# Altium schematic sheet Sheet1.SchDoc
size A4; SheetNumber: 1; SheetTotal: 1
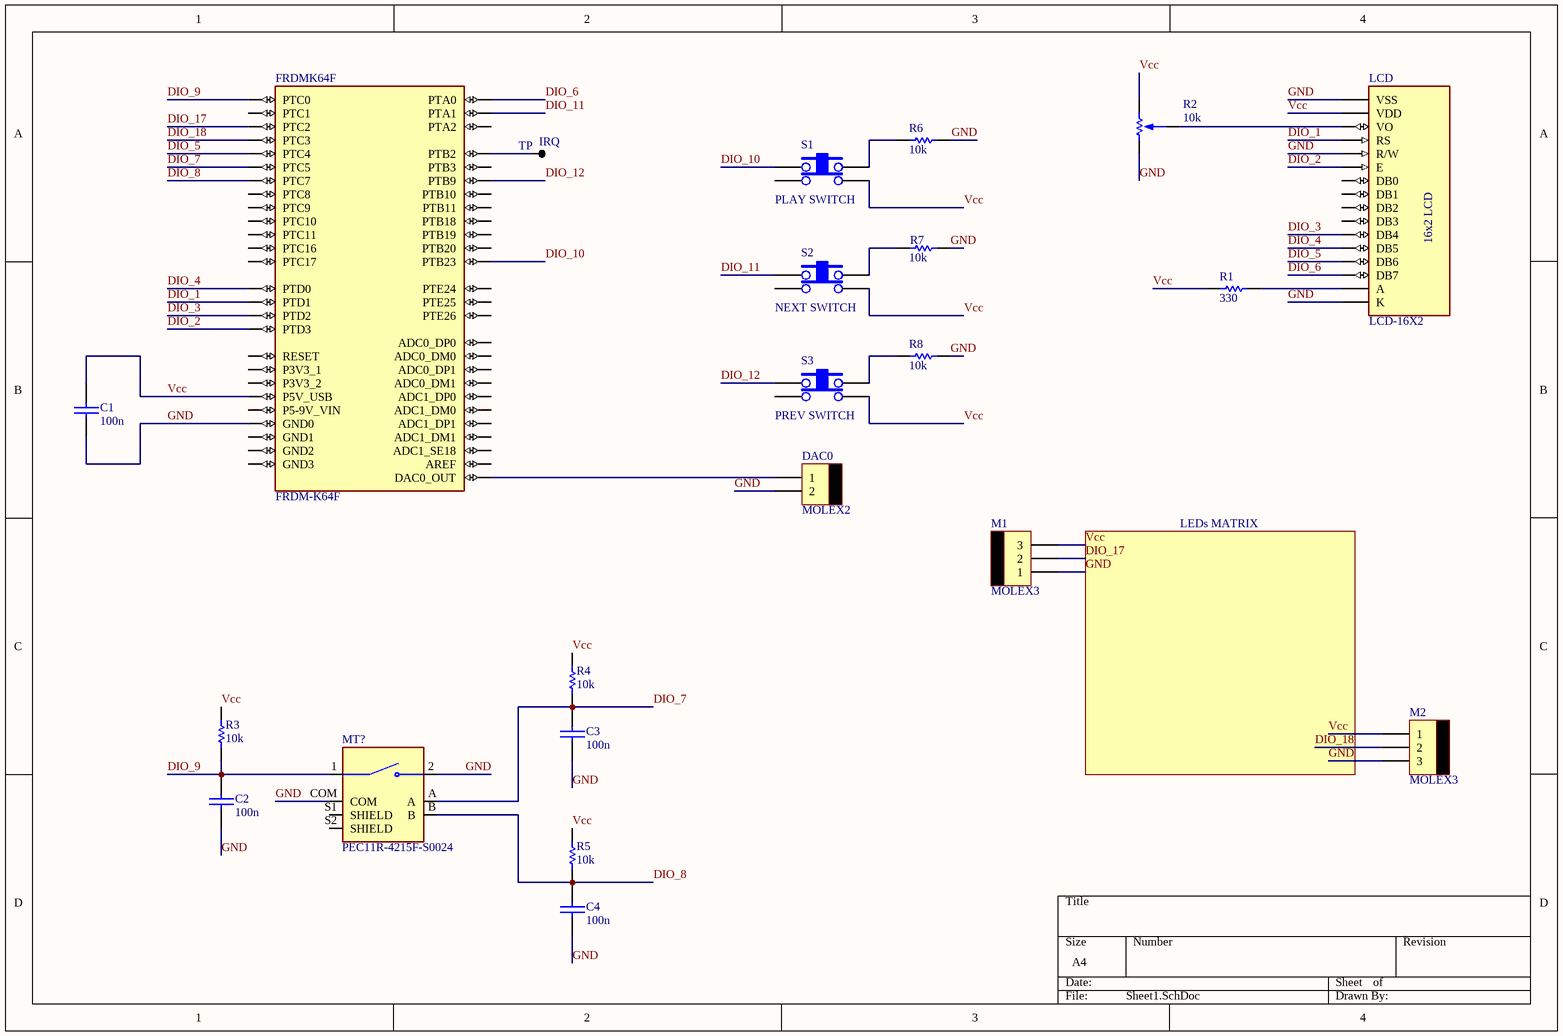
[diagram p0: Sheet1.SchDoc]

## Parts
C1  100n  [0805]
C2  100n  [0805]
C3  100n  [0805]
C4  100n  [0805]
DAC0  MOLEX2  [MOLEX2]
FRDMK64F  FRDM-K64F  [FRDM-K64F]
IRQ  TP  [TPTH]
LCD  LCD-16X2  [MODULE_LCD-16X2]
M1  MOLEX3  [MOLEX3]
M2  MOLEX3  [MOLEX3]
MT?  PEC11R-4215F-S0024  [XDCR_PEC11R-4215F-S0024]
R1  330  [0805]
R2  10k  [PRESET V]
R3  10k  [0805]
R4  10k  [0805]
R5  10k  [0805]
R6  10k  [0805]
R7  10k  [0805]
R8  10k  [0805]
S1  PLAY SWITCH  [TACTSWITCH]
S2  NEXT SWITCH  [TACTSWITCH]
S3  PREV SWITCH  [TACTSWITCH]

## Nets
DIO_1: FRDMK64F.J2-12(PTD1) LCD.4(RS)
DIO_2: FRDMK64F.J2-10(PTD3) LCD.6(E)
DIO_3: FRDMK64F.J2-8(PTD2) LCD.11(DB4)
DIO_4: FRDMK64F.J2-6(PTD0) LCD.12(DB5)
DIO_5: FRDMK64F.J2-4(PTC4) LCD.13(DB6)
DIO_6: FRDMK64F.J2-2(PTA0) LCD.14(DB7)
DIO_7: C3.1 FRDMK64F.J1-15(PTC5) MT?.A R4.1
DIO_8: C4.1 FRDMK64F.J1-13(PTC7) MT?.B R5.1
DIO_9: C2.1 FRDMK64F.J1-11(PTC0) MT?.1 R3.1
DIO_10: FRDMK64F.J1-10(PTB23) S1.1
DIO_11: FRDMK64F.J1-8(PTA1) S2.1
DIO_12: FRDMK64F.J1-6(PTB9) S3.1
DIO_17: FRDMK64F.J1-14(PTC2) M1.2
DIO_18: FRDMK64F.J1-16(PTC3) M2.2
GND: C1.2 C2.2 C3.2 C4.2 DAC0.2 FRDMK64F.J2-3(GND0) LCD.1(VSS) LCD.5(R/W) LCD.16(K) M1.1 M2.3 MT?.2 MT?.COM R2.3 R6.1 R7.1 R8.1
Vcc: C1.1 FRDMK64F.J3-10(P5V_USB) LCD.2(VDD) M1.3 M2.1 R1.1 R2.1 R3.2 R4.2 R5.2 S1.4 S2.4 S3.4
NetDAC0_1: DAC0.1 FRDMK64F.J4-11(DAC0_OUT)
NetFRDMK64F_J4-2: FRDMK64F.J4-2(PTB2) IRQ.1
NetLCD_3: LCD.3(VO) R2.2
NetLCD_15: LCD.15(A) R1.2
NetR6_2: R6.2 S1.3
NetR7_2: R7.2 S2.3
NetR8_2: R8.2 S3.3

Not connected (* = marked no-connect by the designer): FRDMK64F J1-1(PTB18) J1-2(PTC16) J1-3(PTB19) J1-4(PTC17) J1-5(PTC1) J1-7(PTC8) J1-9(PTC9) J1-12(PTA2) J2-1(PTE26) J2-5(ADC0_DP0) J2-7(ADC0_DM0) J2-11(ADC1_DP0) J2-13(ADC1_DM0) J2-14(GND1) J2-16(AREF) J2-17(ADC1_SE18) J2-18(PTE25) J2-20(PTE24) J3-4(P3V3_1) J3-6(RESET) J3-8(P3V3_2) J3-12(GND2) J3-14(GND3) J3-16(P5-9V_VIN) J4-1(ADC0_DP1) J4-3(ADC0_DM1) J4-4(PTB3) J4-5(ADC1_DP1) J4-6(PTB10) J4-7(ADC1_DM1) J4-8(PTB11) J4-9(PTB20) J4-10(PTC11) J4-12(PTC10); LCD 7(DB0) 8(DB1) 9(DB2) 10(DB3); MT? S1(SHIELD) S2(SHIELD); S1 2; S2 2; S3 2

## Notes on the sheet
- LEDs MATRIX
- (in symbol LCD-16X2) 16x2 LCD

## Library data of the parts
C1-C4 = CAP
FRDMK64F = FRDM-K64F: K24, K63, K64, mbed-Enabled Development Freedom Kinetis ARMÂ® CortexÂ®-M4 MCU 32-Bit Embedded Evaluation Board; MF: NXP USA; Package: None; Value: *; Price: None; MP: FRDM-K64F; SnapEDA_Link: https://www.snapeda.com/parts/FRDM-K64F/NXP%20USA%20Inc./view-part/508270/?ref=snap; Availability: Unavailable
LCD = LCD-16X2: Display Development Tools 16x2 Black on Green Char LCD w Backlight; MF: Gravitech; Package: None; Price: None; Value: *; SnapEDA_Link: https://www.snapeda.com/parts/LCD-16X2/Gravitech/view-part/?ref=snap; MP: LCD-16X2; Availability: Not in stock; Check_prices: https://www.snapeda.com/parts/LCD-16X2/Gravitech/view-part/?ref=eda
MT? = PEC11R-4215F-S0024: Incremental Encoder, 12 Mm, Contact Rating 10 Ma - 5 Vdc; Price: None; Availability: Unavailable; MP: PEC11R-4215F-S0024; Value: *; Package: None
R1 R3-R8 = RES
R2 = PRESET
S1-S3 = TACT SWITCH